# Altium schematic sheet LEDs.SchDoc
size A4; SheetNumber: 1; SheetTotal: 1
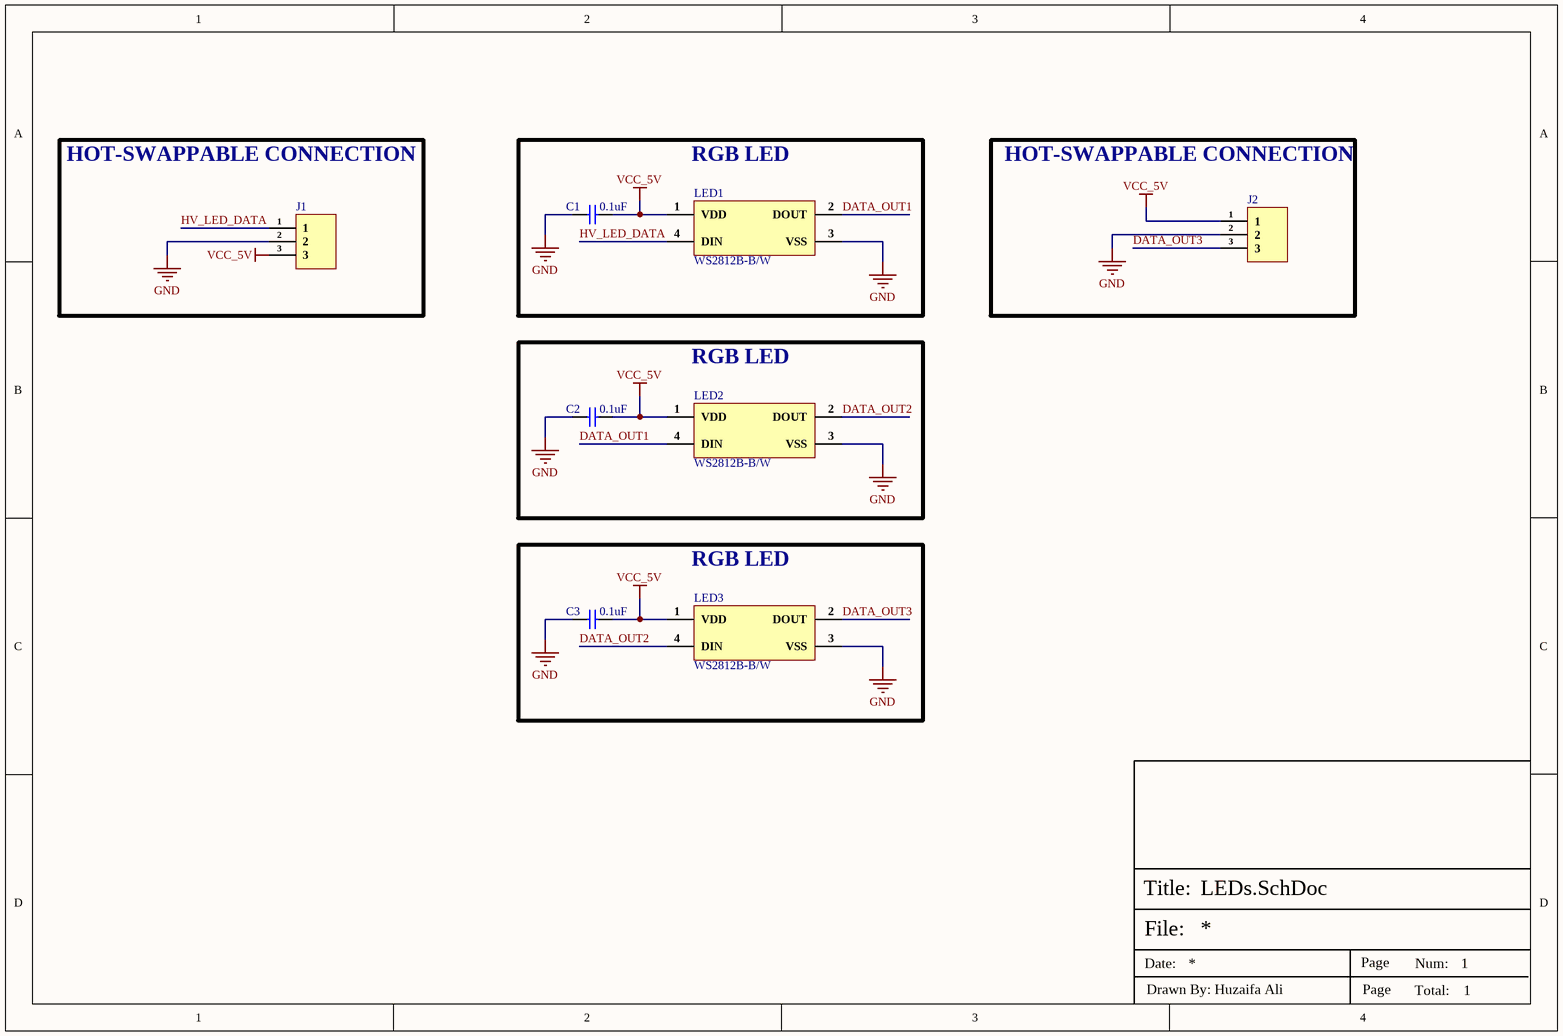
[diagram p0: LEDs.SchDoc]

## Parts
C1  0.1uF  [Cap-0603]
C2  0.1uF  [Cap-0603]
C3  0.1uF  [Cap-0603]
J1  B3P-VH(LF)(SN)  [B3P-VH(LF)(SN)]  (value not drawn)
J2  B3P-VH(LF)(SN)  [B3P-VH(LF)(SN)]  (value not drawn)
LED1  WS2812B-B/W  [WS2812B-B/W]
LED2  WS2812B-B/W  [WS2812B-B/W]
LED3  WS2812B-B/W  [WS2812B-B/W]

## Blocks framed on the sheet
HOT-SWAPPABLE CONNECTION: J1
RGB LED: C1 LED1
HOT-SWAPPABLE CONNECTION: J2
RGB LED: C2 LED2
RGB LED: C3 LED3

## Nets
GND: C1.2 C2.2 C3.2 J1.2 J2.2 LED1.3(VSS) LED2.3(VSS) LED3.3(VSS)
VCC_5V: C1.1 C2.1 C3.1 J1.3 J2.1 LED1.1(VDD) LED2.1(VDD) LED3.1(VDD)
DATA_OUT1: LED1.2(DOUT) LED2.4(DIN)
DATA_OUT2: LED2.2(DOUT) LED3.4(DIN)
DATA_OUT3: J2.3 LED3.2(DOUT)
HV_LED_DATA: J1.1 LED1.4(DIN)

## Notes on the sheet
- File:
- Title:
- Date:
- Page
- Num:
- Total:
- Drawn By: Huzaifa Ali

## Library data of the parts
C1-C3 = CC0603KRX5R9BB104: CAP CER 0.1UF 50V X5R 0603; Manufacturer: Yageo; Capacitance: 100nF; Tolerance: 10%; Item Type: Capacitor; Supplier 1: Digi-Key; Manufacturer Part Number: CC0603KRX5R9BB104; RoHS: Yes; Category: Ceramic Capacitors; Stock 1: 152253; Pricing 1: 1=0.10000, 10=0.05200, 50=0.02820, 100=0.02310, 500=0.01648, 1000=0.01294 (USD); Mount: Surface Mount; Case/Package: 0603; Case Code (Imperial): 0603; Case Code (Metric): 1608; Weight: 7.1E-05oz; Min Operating Temperature: -55°C; Max Operating Temperature: 85°C; Packaging: Tape and Reel; Voltage Rating: 50V; Dielectric: X5R; Termination: SMD/SMT; Voltage Rating (DC): 50V; Package Quantity: 4000; Length: 0.063inch; Width: 0.031inch; Thickness: 0.035inch; Lead Free: Lead Free; Halogen Free: Halogen Free; ComponentLink1URL: http://www.mouser.com/ds/2/447/Yageo_UPY-GP_NP0_16V-to-50V_9-358835.pdf?src-supplier=Mouser; ComponentLink1Description: http://www.mouser.com/ds/2/447/Yageo_UPY-GP_NP0_16V-to-50V_9-358835.pdf?src-supplier=Mouser; ComponentLink2URL: https://www.yageo.com/upload/media/product/productsearch/datasheet/mlcc/UPY-GPHC_X5R_4V-to-50V_26.pdf?src-supplier=Digi-Key; ComponentLink2Description: https://www.yageo.com/upload/media/product/productsearch/datasheet/mlcc/UPY-GPHC_X5R_4V-to-50V_26.pdf?src-supplier=Digi-Key; ComponentLink3URL: http://www.yageo.com/exep/pages/download/literatures/ProductSelectionGuide%202014_Final_2.pdf?src-supplier=Digi-Key; ComponentLink3Description: http://www.yageo.com/exep/pages/download/literatures/ProductSelectionGuide%202014_Final_2.pdf?src-supplier=Digi-Key; Supplier Part Number 1: 311-4046-1-ND; LCSC Part Number: C110022
J1 J2 = B3P-VH(LF)(SN): 1x3P VH 1 3.96mm 3 Brass Plugin,P=3.96mm Wire To Board / Wire To Wire Connector ROHS; Manufacture: JST Sales America; ComponentLink1Description: LCSC; ComponentLink1URL: https://www.lcsc.com/product-detail/Wire-To-Board-Wire-To-Wire-Connector_JST-Sales-America-B3P-VH-LF-SN_C160316.html; Manufacture part number: B3P-VH(LF)(SN); Pakage: Plugin,P=3.96mm; LCSC part number: C160316; Item type: Connector
LED1-LED3 = WS2812B-B/W: RGB SMD5050 Light Emitting Diodes (LED) ROHS; Manufacturer: Worldsemi; Item Type: RGB LED; Manufacturer Part Number: WS2812B-B/W; Package: SMD5050; LCSC Part Number: C114586; ComponentLink1Description: LCSC; ComponentLink1URL: https://www.lcsc.com/product-detail/Light-Emitting-Diodes-LED_Worldsemi-WS2812B-B-W_C114586.html